# EasyEDA Pro project ProPrj_省赛排插板.epro

# Schematic Schematic1
Board Name: Board1; Create Date: 2025-03-26; Page Name: P1; Project Name: 省赛1; Schematic Name: Schematic1; Update Date: 2025-04-08; Company: 嘉立创EDA; Page Size: A4; Version: V1.0
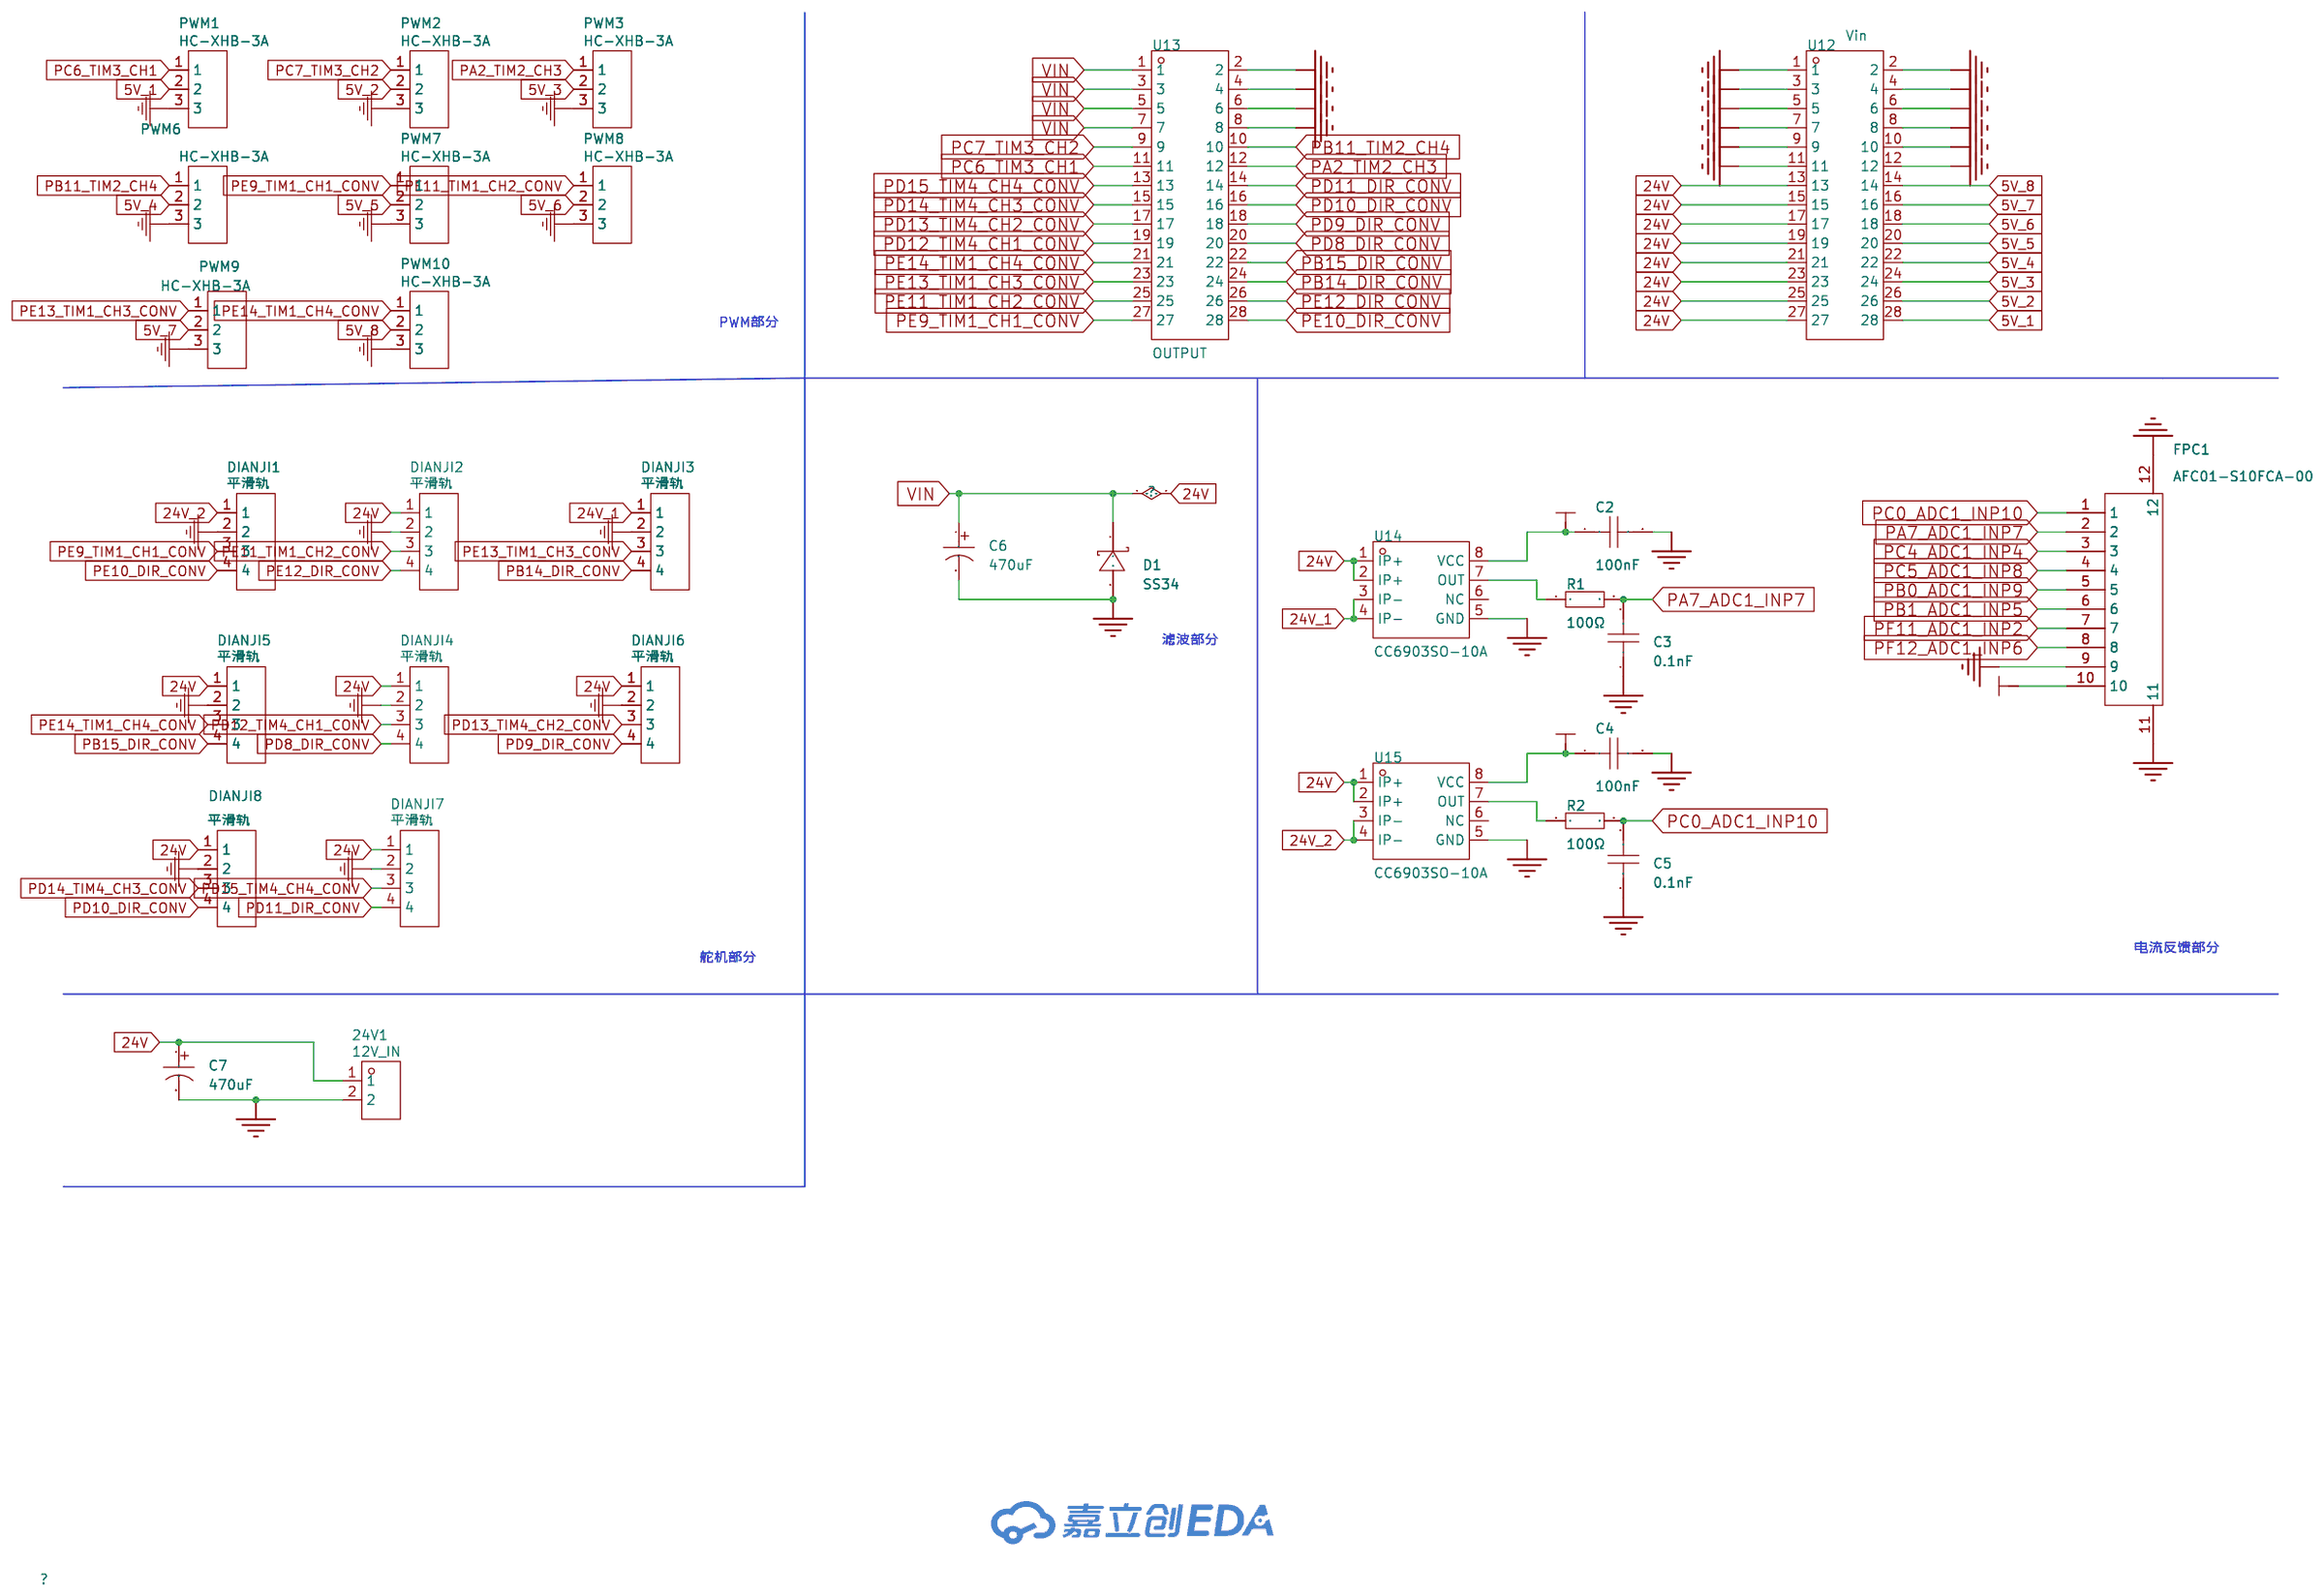
[diagram p0: schematic sheet]

## Parts
24V1  12V_IN  [CONN-TH_XY2500V-A-5.00-2P]
C2  100nF  [C0603]
C3  0.1nF  [C0603]
C4  100nF  [C0603]
C5  0.1nF  [C0603]
C6  470uF  [CAP-TH_BD10.0-P5.00-D1.0-FD]
C7  470uF  [CAP-TH_BD10.0-P5.00-D1.0-FD]
D1  SS34  [SMA_L4.3-W2.6-LS5.2-RD]
DIANJI1  平滑轨  [CONN-TH_XY2500V-A-5.00-4P]
DIANJI2  平滑轨  [CONN-TH_XY2500V-A-5.00-4P]
DIANJI3  平滑轨  [CONN-TH_XY2500V-A-5.00-4P]
DIANJI4  平滑轨  [CONN-TH_XY2500V-A-5.00-4P]
DIANJI5  平滑轨  [CONN-TH_XY2500V-A-5.00-4P]
DIANJI6  平滑轨  [CONN-TH_XY2500V-A-5.00-4P]
DIANJI7  平滑轨  [CONN-TH_XY2500V-A-5.00-4P]
DIANJI8  平滑轨  [CONN-TH_XY2500V-A-5.00-4P]
FPC1  AFC01-S10FCA-00  [FPC-SMD_P0.5-10P_FGS-XJ-H2.0]
PWM1  HC-XHB-3A  [CONN-TH_3P-P2.50_HC-XHB-3A]
PWM2  HC-XHB-3A  [CONN-TH_3P-P2.50_HC-XHB-3A]
PWM3  HC-XHB-3A  [CONN-TH_3P-P2.50_HC-XHB-3A]
PWM6  HC-XHB-3A  [CONN-TH_3P-P2.50_HC-XHB-3A]
PWM7  HC-XHB-3A  [CONN-TH_3P-P2.50_HC-XHB-3A]
PWM8  HC-XHB-3A  [CONN-TH_3P-P2.50_HC-XHB-3A]
PWM9  HC-XHB-3A  [CONN-TH_3P-P2.50_HC-XHB-3A]
PWM10  HC-XHB-3A  [CONN-TH_3P-P2.50_HC-XHB-3A]
R1  100Ω  [Res_1/8W]
R2  100Ω  [Res_1/8W]
U12  Vin  [HDR-TH_28P-P2.54-H-F-R2-C14-W8.5]
U13  OUTPUT  [HDR-TH_28P-P2.54-H-F-R2-C14-W8.5]
U14  CC6903SO-10A  [SOP-8_L4.9-W3.9-P1.27-LS6.0-BL]
U15  CC6903SO-10A  [SOP-8_L4.9-W3.9-P1.27-LS6.0-BL]

## Library data of the parts
24V1 = 12V_IN: Supplier: LCSC; Supplier Part: C505761; Manufacturer: XINLAIYA(新莱亚); Manufacturer Part: XY2500V-A-5.00-2P; JLCPCB Part Class: Extended Part
C2-C5 = CGA0603X7R104K500JT: 容值:100nF;精度:±10%;额定电压:50V;温度系数:X7R;; LCSC Part Name: 100nF ±10% 50V; Supplier Part: C6119867; Manufacturer: HRE(芯声); Supplier Footprint: 0603; JLCPCB Part Class: 扩展库; Datasheet: https://atta.szlcsc.com/upload/public/pdf/source/20250103/C44077DA9E7B3EFAE02F22B6D3D1CBC9.pdf; Supplier: LCSC; Tolerance: ±10%; Voltage Rating: 50V; Temperature Coefficient: X7R
C6 C7 = ERS1HM471G20OT: 容值:470uF;精度:±20%;额定电压:50V;; LCSC Part Name: 470uF ±20% 50V; Supplier Part: C106666; Manufacturer: AISHI(艾华集团); Supplier Footprint: 插件,D10xL20mm; JLCPCB Part Class: 扩展库; Datasheet: https://atta.szlcsc.com/upload/public/pdf/source/20191015/C438940_4B8E60A742BB0AE40DDEF87A5C89089D.pdf; Supplier: LCSC; Tolerance: ±20%; Rated Voltage: 50V; Lead Spacing: 5mm; φD: 10mm; L: 20mm; Lifetime @ Temp: 7000hrs@105℃
D1 = SS34_C8678: 二极管配置:独立式;正向压降(Vf):550mV@3A;直流反向耐压(Vr):40V;整流电流:3A;; LCSC Part Name: 电压:40V 电流:3A; Supplier Part: C8678; Manufacturer: MDD(辰达半导体); Supplier Footprint: SMA(DO-214AC); JLCPCB Part Class: 基础库; Datasheet: https://atta.szlcsc.com/upload/public/pdf/source/20240710/2118BB86FDDB2E0B294389AC1F3F65C8.pdf; Supplier: LCSC; Diode Configuration: 独立式; Forward Voltage (Vf@If): 550mV@3A; Reverse Voltage (Vr): 40V; Rectified Current: 3A; Reverse Leakage Current (Ir): 500uA@40V
DIANJI1-DIANJI8 = 平滑轨: Supplier: LCSC; Supplier Part: C505763; Manufacturer: XINLAIYA(新莱亚); Manufacturer Part: XY2500V-A-5.00-4P; JLCPCB Part Class: Extended Part
FPC1 = AFC01-S10FCA-00: 锁定特性:翻盖式;触点类型:下接;触点数量:10P;间距:0.5mm;安装类型:卧贴;; LCSC Part Name: 间距:0.5mm P数:10P 翻盖式 下接; Supplier Part: C262659; Manufacturer: JS(钜硕电子); Supplier Footprint: SMD,P=0.5mm,卧贴; JLCPCB Part Class: 扩展库; Datasheet: https://atta.szlcsc.com/upload/public/pdf/source/20190816/C413942_2A72D1AC756EAE17EEDF756A339D4500.pdf; Supplier: LCSC; Locking Feature: 翻盖式; Contact Type: 下接; Number of Contacts: 10P; Pitch: 0.5mm; Mounting Type: 卧贴; FFC, FCB Thickness: 0.3mm; Height Above Board: 2mm
PWM1-PWM3 PWM6-PWM10 = HC-XHB-3A: Supplier: LCSC; Supplier Part: C2845491; Manufacturer: HCTL(华灿天禄); JLCPCB Part Class: Extended Part
R1 R2 = Res_AXIAL-1/8W: Supplier Footprint: 轴向引线
U12 U13 = PM254-2-14-W-8.5: 插孔结构:2x14P;间距:2.54mm;行距:2.54mm;圆孔/方孔:方孔;安装类型:弯插;排数:双排;总孔位数:28P;额定电流:3A;额定电压:-;插孔方向:侧面;塑高:8.5mm;触头材质:铜合金;工作温度范围:-40℃~+105℃;焊接温度(最大值):260℃@5S;; LCSC Part Name: 2x14P 间距:2.54mm 弯插; Supplier Part: C2897434; Manufacturer: HCTL(华灿天禄); Supplier Footprint: 弯插,P=2.54mm; JLCPCB Part Class: 扩展库; Datasheet: https://atta.szlcsc.com/upload/public/pdf/source/20230609/283C0D22EF4E6FFE03D5A855876981ED.pdf; Supplier: LCSC; Holes Structure: 2x14P; Pitch: 2.54mm; Row Spacing: 2.54mm; Circular Hole / Square Hole: 方孔; Mounting Type: 弯插; Number of Rows: 双排; Number of Holes: 28P; Current Rating (Max): 3A; Holes Direction: 侧面; Insulation Height: 8.5mm; Contact Material: 铜合金; Operating Temperature Range: -40℃~+105℃; Soldering Temperature(Max): 260℃@5S
U14 U15 = CC6903SO-10A: 电流测量范围:-10A~10A;隔离耐压:100Vrms;灵敏度:132mV/A;; Supplier Part: C469386; Manufacturer: CrossChip(成都芯进); Supplier Footprint: SOP-8; JLCPCB Part Class: 扩展库; Datasheet: https://atta.szlcsc.com/upload/public/pdf/source/20210401/C469386_736CACCB33E89B0F82D9E8414A64AB06.pdf; Supplier: LCSC; Current Range: -10A~10A; Supply Voltage: 3.3V; Isolated Voltage Withstand: 100Vrms; Sensitivity: 132mV/A; Standby Current: 5mA; Operating Temperature: -40℃~+125℃

## Nets
3V32: C2.1 C4.1 FPC1.10 U14.8(VCC) U15.8(VCC)
5V_1: PWM1.2 U12.28
5V_2: PWM2.2 U12.26
5V_3: PWM3.2 U12.24
5V_4: PWM6.2 U12.22
5V_5: PWM7.2 U12.20
5V_6: PWM8.2 U12.18
5V_7: PWM9.2 U12.16
5V_8: PWM10.2 U12.14
24V: 24V1.1 C6.1 C7.1 D1.1(K) DIANJI2.1 DIANJI4.1 DIANJI5.1 DIANJI6.1 DIANJI7.1 DIANJI8.1 U12.13 U12.15 U12.17 U12.19 U12.21 U12.23 U12.25 U12.27 U13.1 U13.3 U13.5 U13.7 U14.1(IP+) U14.2(IP+) U15.1(IP+) U15.2(IP+)
24V_1: DIANJI3.1 U14.3(IP-) U14.4(IP-)
24V_2: DIANJI1.1 U15.3(IP-) U15.4(IP-)
GND: 24V1.2 C2.2 C3.1 C4.2 C5.1 C6.2 C7.2 D1.2(A) DIANJI1.2 DIANJI2.2 DIANJI3.2 DIANJI4.2 DIANJI5.2 DIANJI6.2 DIANJI7.2 DIANJI8.2 FPC1.9 FPC1.11 FPC1.12 PWM1.3 PWM2.3 PWM3.3 PWM6.3 PWM7.3 PWM8.3 PWM9.3 PWM10.3 U12.1 U12.2 U12.3 U12.4 U12.5 U12.6 U12.7 U12.8 U12.9 U12.10 U12.11 U12.12 U13.2 U13.4 U13.6 U13.8 U14.5(GND) U15.5(GND)
PA2_TIM2_CH3: PWM3.1 U13.12
PA7_ADC1_INP7: C3.2 FPC1.2 R1.2
PB0_ADC1_INP9: FPC1.5
PB1_ADC1_INP5: FPC1.6
PB11_TIM2_CH4: PWM6.1 U13.10
PB14_DIR_CONV: DIANJI3.4 U13.24
PB15_DIR_CONV: DIANJI5.4 U13.22
PC0_ADC1_INP10: C5.2 FPC1.1 R2.2
PC4_ADC1_INP4: FPC1.3
PC5_ADC1_INP8: FPC1.4
PC6_TIM3_CH1: PWM1.1 U13.11
PC7_TIM3_CH2: PWM2.1 U13.9
PD8_DIR_CONV: DIANJI4.4 U13.20
PD9_DIR_CONV: DIANJI6.4 U13.18
PD10_DIR_CONV: DIANJI8.4 U13.16
PD11_DIR_CONV: DIANJI7.4 U13.14
PD12_TIM4_CH1_CONV: DIANJI4.3 U13.19
PD13_TIM4_CH2_CONV: DIANJI6.3 U13.17
PD14_TIM4_CH3_CONV: DIANJI8.3 U13.15
PD15_TIM4_CH4_CONV: DIANJI7.3 U13.13
PE9_TIM1_CH1_CONV: DIANJI1.3 PWM7.1 U13.27
PE10_DIR_CONV: DIANJI1.4 U13.28
PE11_TIM1_CH2_CONV: DIANJI2.3 PWM8.1 U13.25
PE12_DIR_CONV: DIANJI2.4 U13.26
PE13_TIM1_CH3_CONV: DIANJI3.3 PWM9.1 U13.23
PE14_TIM1_CH4_CONV: DIANJI5.3 PWM10.1 U13.21
PF11_ADC1_INP2: FPC1.7
PF12_ADC1_INP6: FPC1.8
$1N7510: R1.1 U14.7(OUT)
$1N7913: R2.1 U15.7(OUT)

Not connected (* = marked no-connect by the designer): U14 6(NC); U15 6(NC)

## Notes on the sheet
- PWM部分
- 滤波部分
- 电流反馈部分
- 舵机部分

# Board PCB1
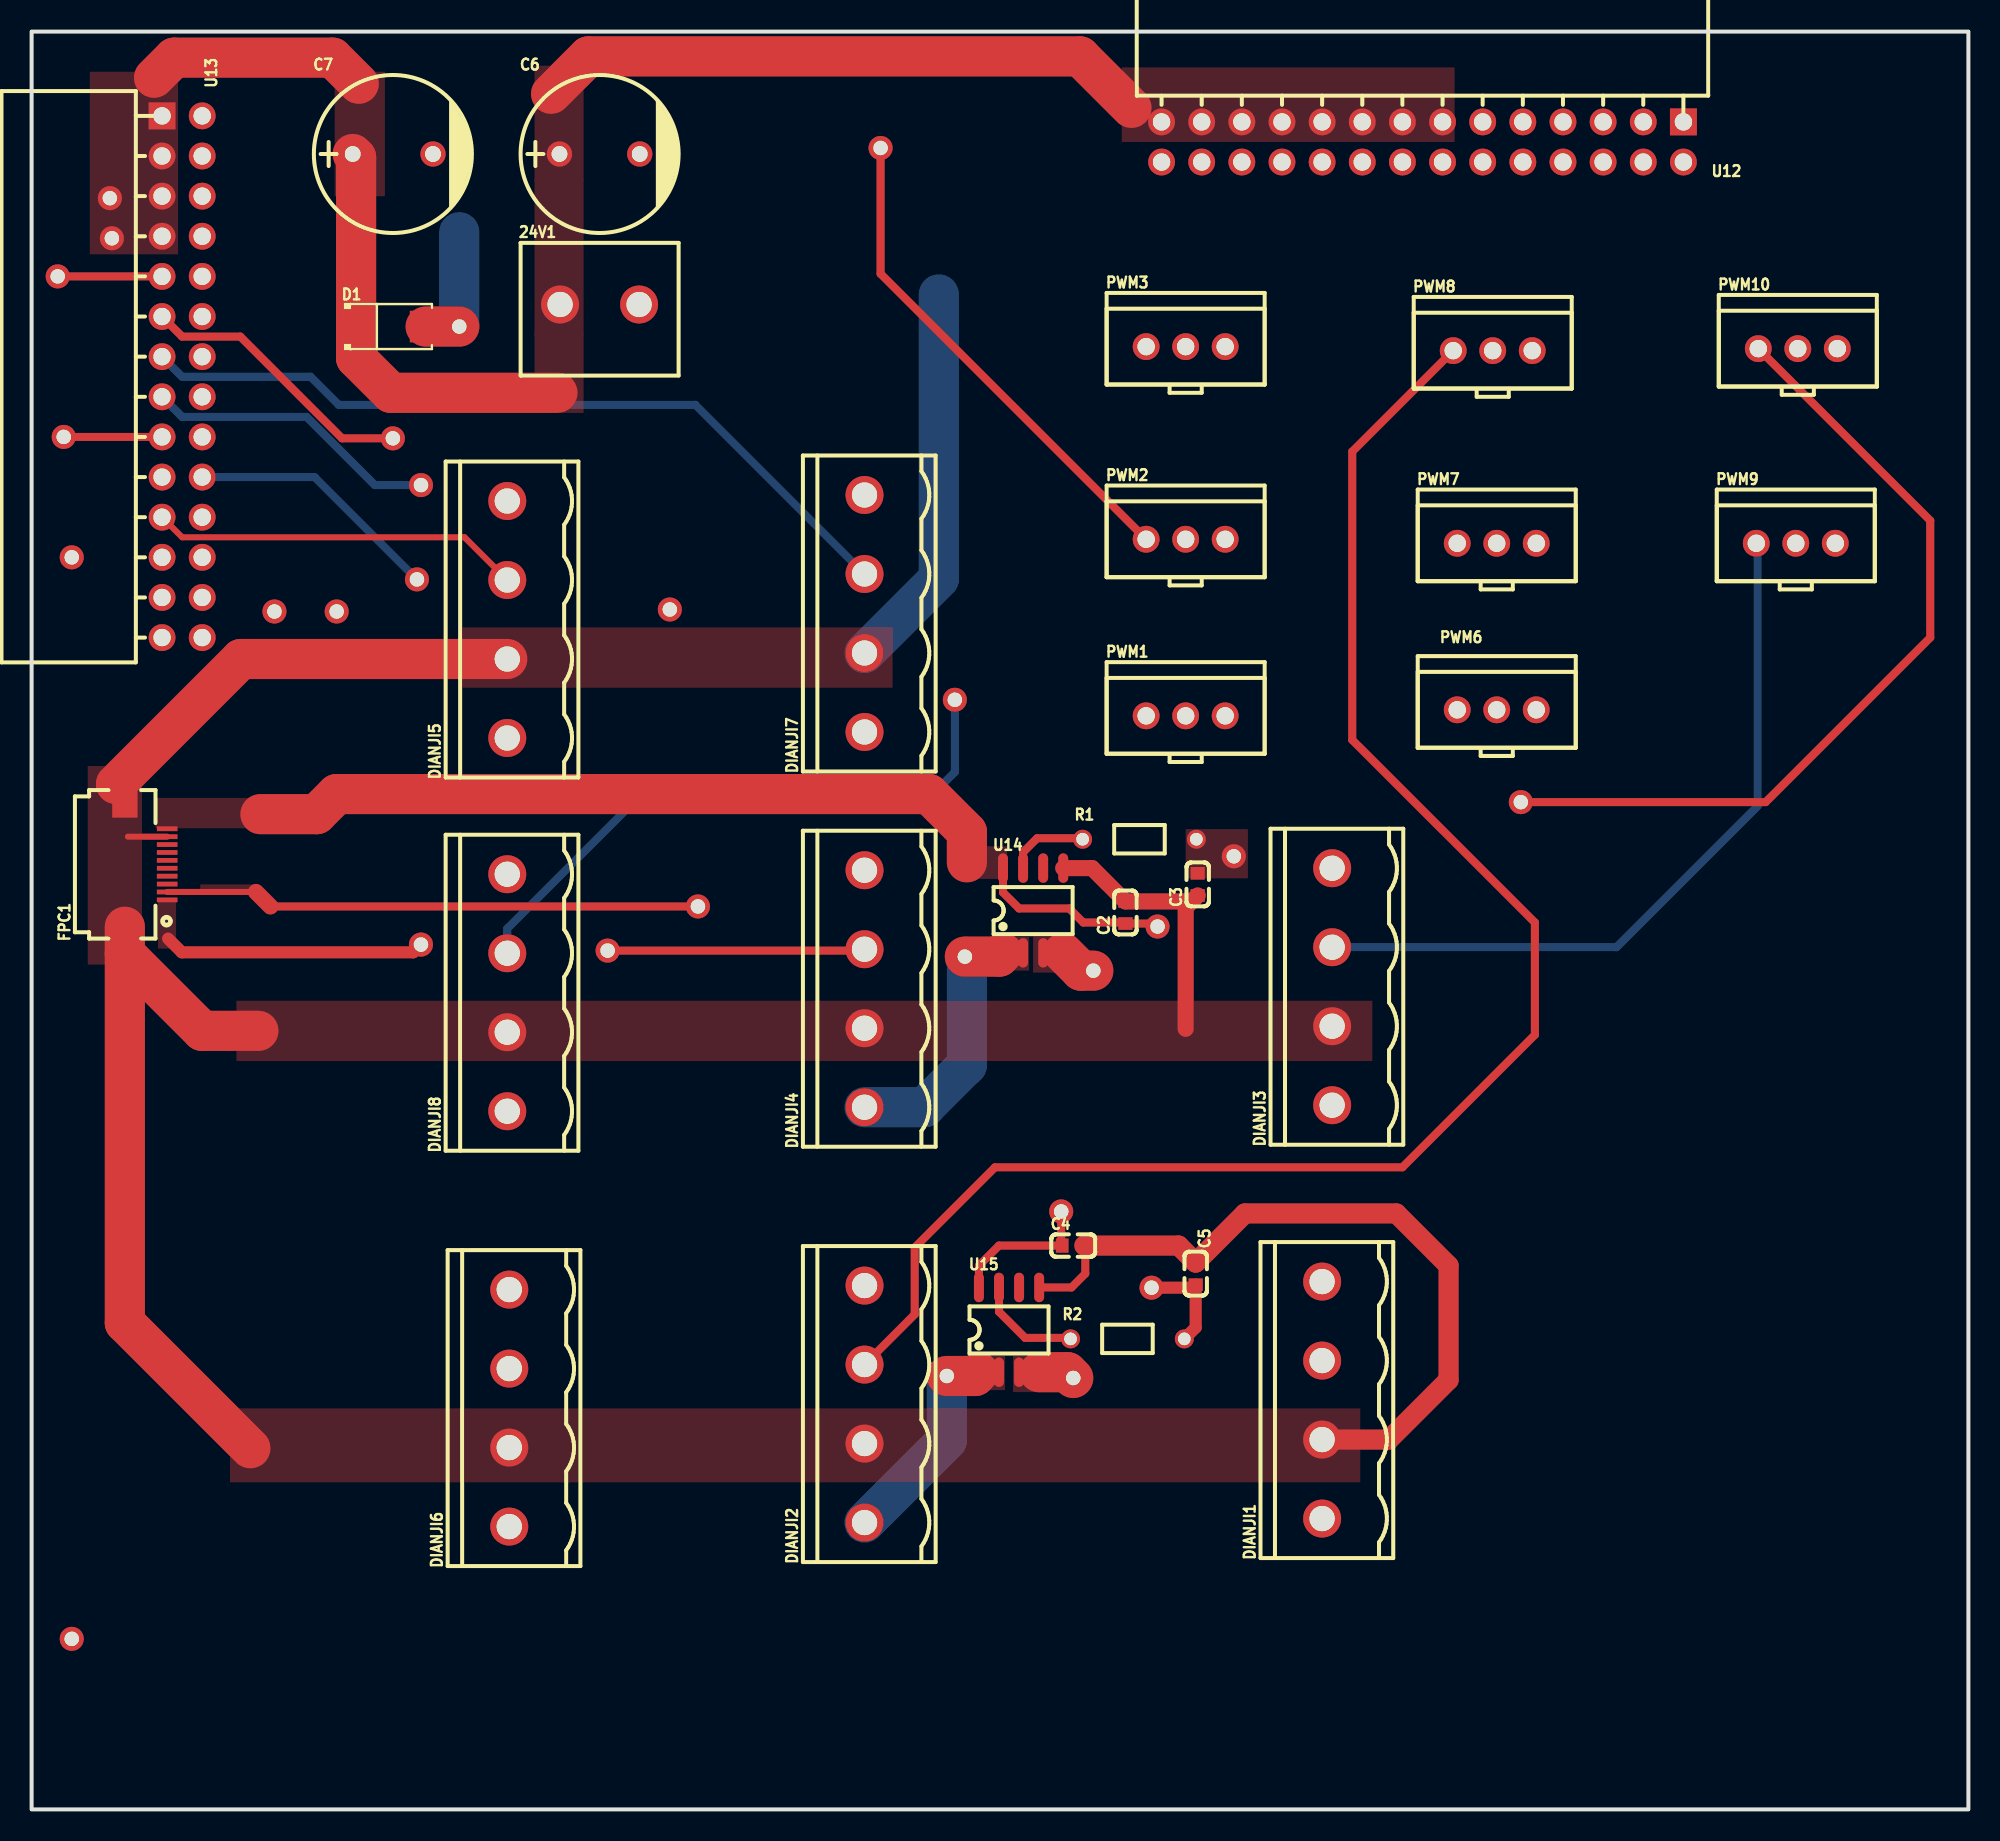
[diagram p1: board, top side]
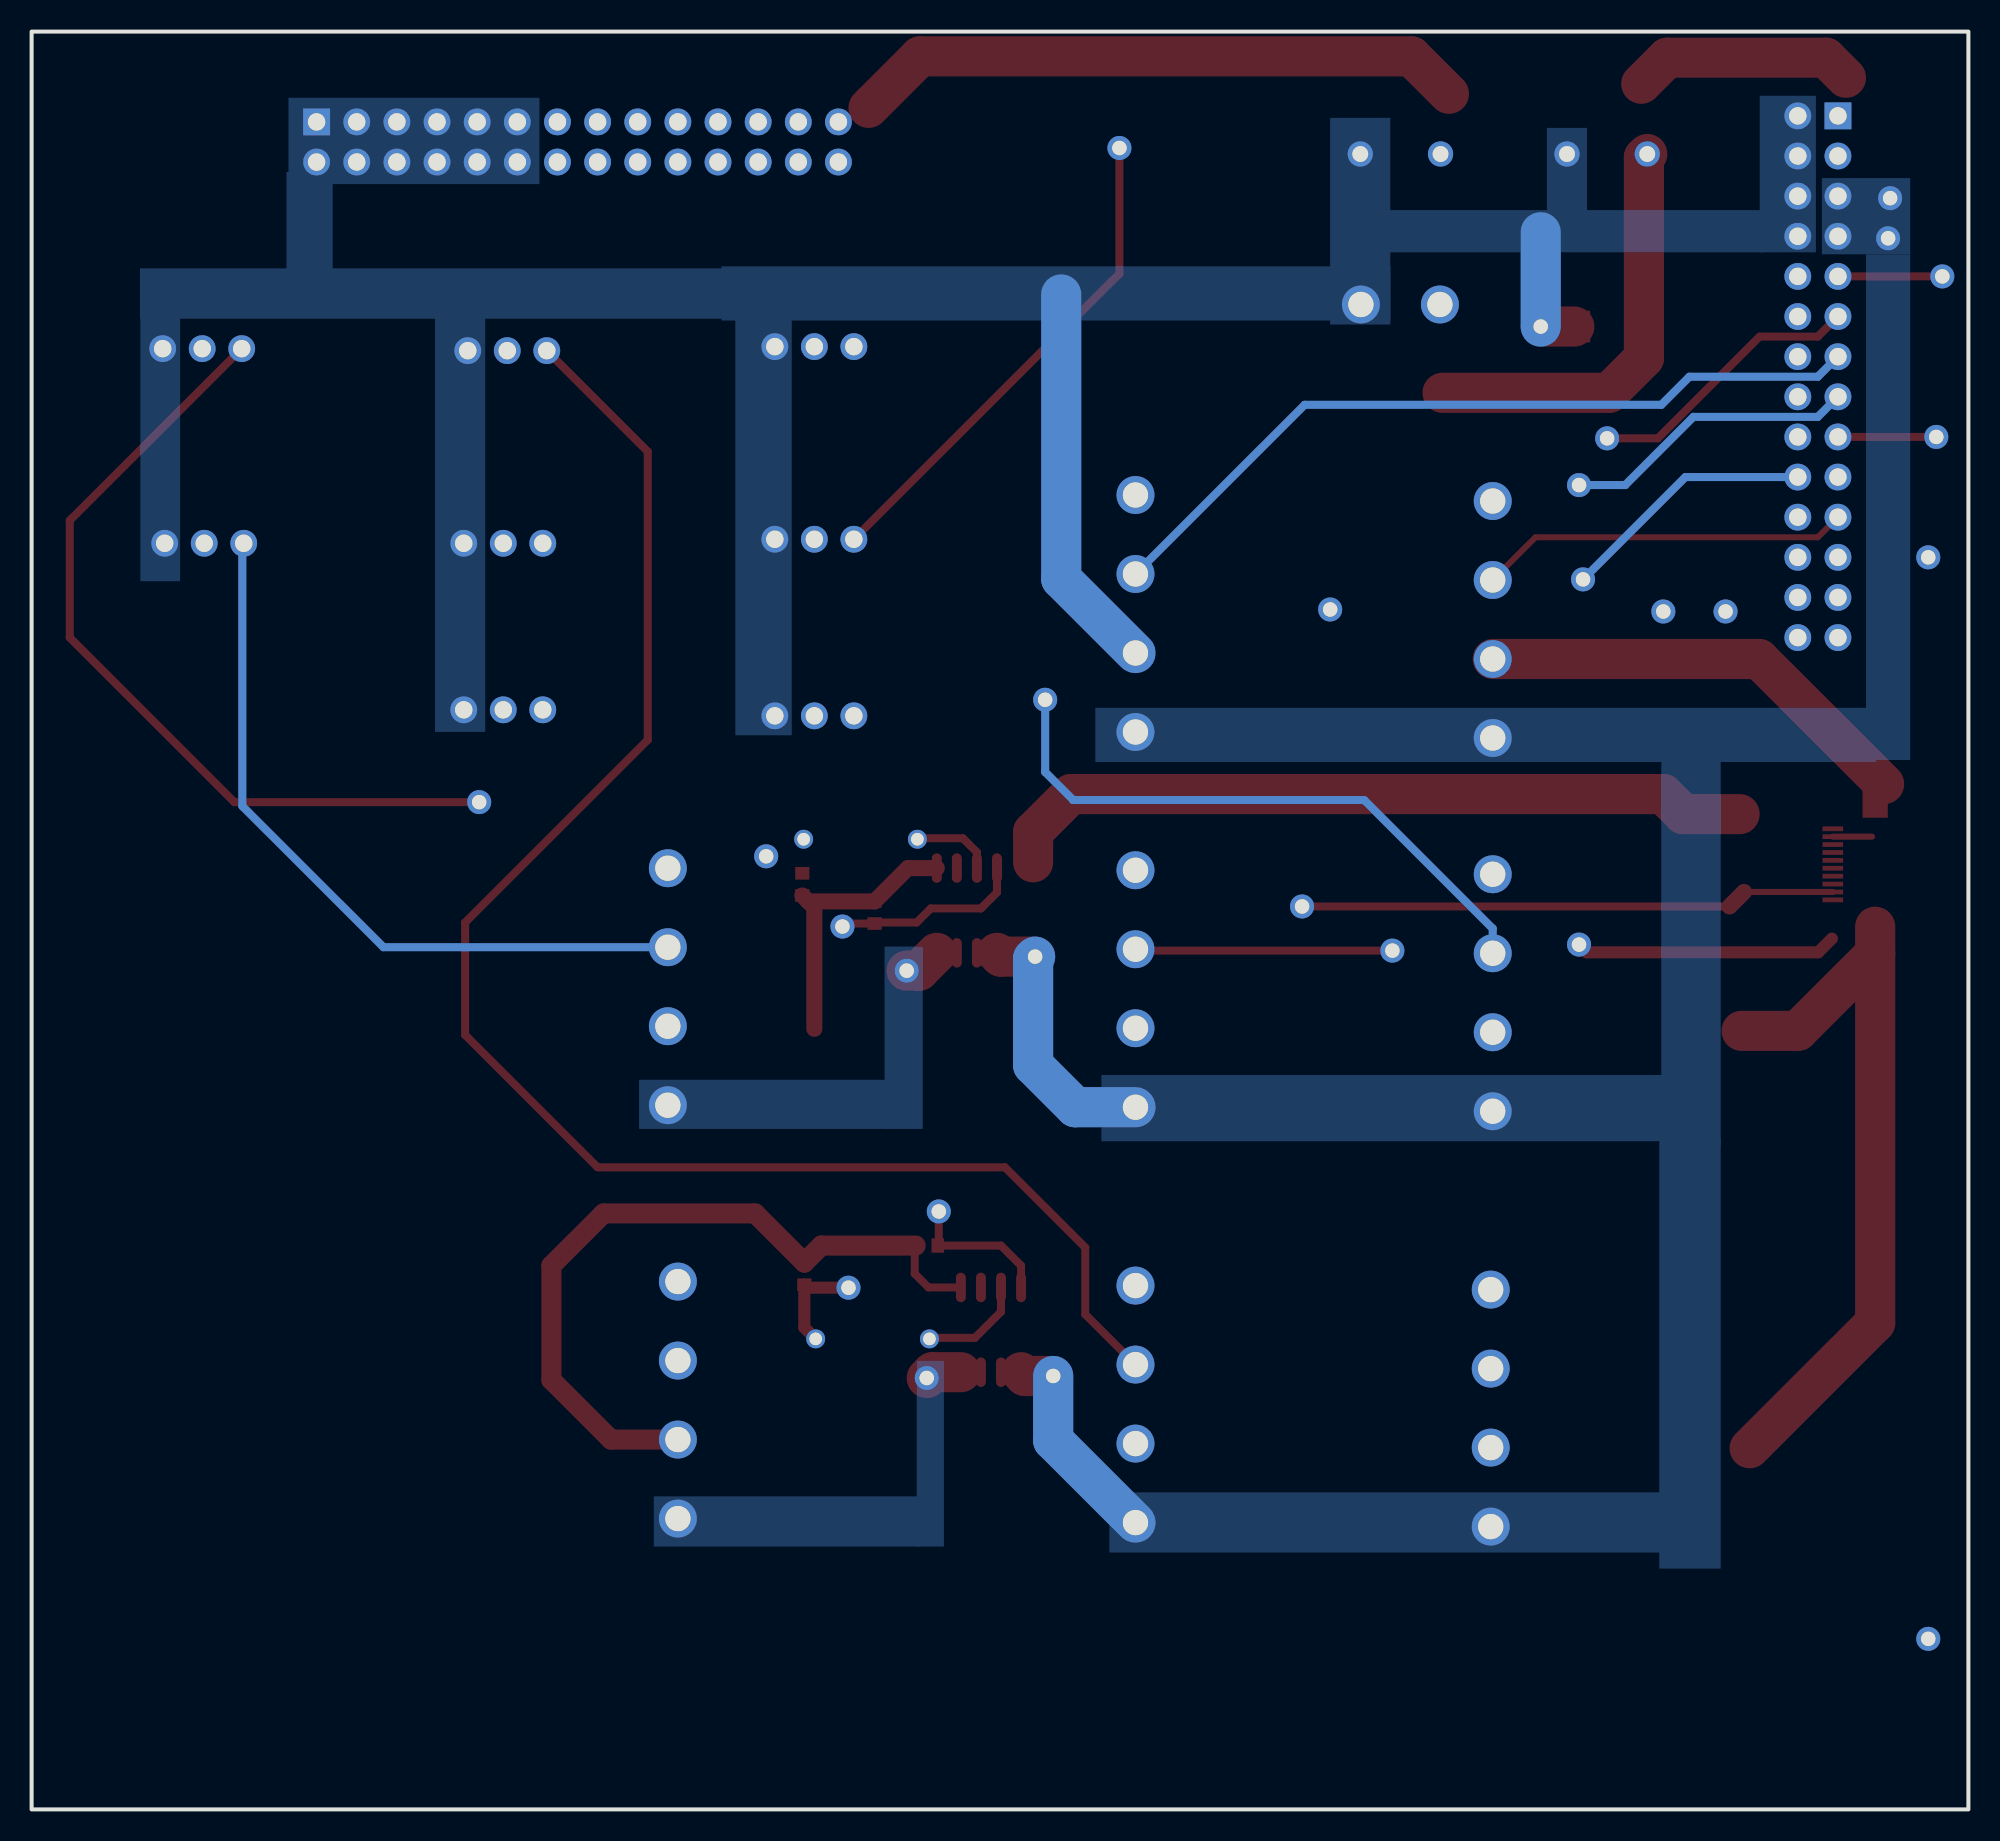
[diagram p2: board, bottom side, seen from below]

Outline 122.56 x 112.52 mm; copper layers: Top Layer, Inner1, Inner2, Bottom Layer. Coordinates in mm from the lower left corner of the outline.
Outline path: rectangle 0,112.52 122.56,0
Stack: Top Layer 0.035mm 外层铜厚1oz / Dielectric1 0.2104mm 7628 RC49% 8.6mil / Inner1 0.0152mm 内层铜厚 / Dielectric2 1.065mm 1.1mm H/HOZ Copper / Inner2 0.0152mm 内层铜厚 / Dielectric3 0.2104mm 7628 RC49% 8.6mil / Bottom Layer 0.035mm 外层铜厚1oz

## Design rules (mm)
template: JLCPCB Capability(Two Layers Board)
spacing copperThickness1oz (default): track to track 0.102, other pairs 0.152 to 0.3
spacing copperThickness2oz: track to track 0.203, other pairs 0.152 to 0.3
track width copperThickness1oz (default): min 0.127, default 0.254, max 2.54
track width copperThickness2oz: min 0.203, default 0.254, max 2.54
differential pair differentialPair (default): width min 0.127, default 0.254, max 2.54; gap min 0.152, default 0.152
via viaSize (default): diameter min 0.5, default 0.61, max 10; hole min 0.3, default 0.305, max 6.3
net GND uses copperThickness2oz
net 24V_1 uses copperThickness2oz
net 24V uses copperThickness2oz
net 24V_2 uses copperThickness2oz
net 3V32 uses copperThickness2oz
net 5V_1 uses copperThickness2oz
net 5V_2 uses copperThickness2oz
net 5V_3 uses copperThickness2oz
net 5V_4 uses copperThickness2oz
net 5V_5 uses copperThickness2oz
net 5V_6 uses copperThickness2oz
net 5V_7 uses copperThickness2oz
net 5V_8 uses copperThickness2oz
net $1N7510 uses copperThickness2oz
net $1N7913 uses copperThickness2oz

## Placement (name value [footprint] x y rotation side)
24V1  12V_IN  [CONN-TH_XY2500V-A-5.00-2P]  35.94 95.25 0 top
C2  100nF  [C0603]  69.22 56.77 90 top
C3  0.1nF  [C0603]  73.79 58.55 90 top
C4  100nF  [C0603]  65.91 35.69 0 top
C5  0.1nF  [C0603]  73.66 33.91 270 top
C6  470uF  [CAP-TH_BD10.0-P5.00-D1.0-FD]  35.94 104.78 0 top
C7  470uF  [CAP-TH_BD10.0-P5.00-D1.0-FD]  22.86 104.78 0 top
D1  SS34  [SMA_L4.3-W2.6-LS5.2-RD]  22.73 93.85 0 top
DIANJI1  平滑轨  [CONN-TH_XY2500V-A-5.00-4P]  81.66 25.91 90 top
DIANJI2  平滑轨  [CONN-TH_XY2500V-A-5.00-4P]  52.7 25.65 90 top
DIANJI3  平滑轨  [CONN-TH_XY2500V-A-5.00-4P]  82.3 52.07 90 top
DIANJI4  平滑轨  [CONN-TH_XY2500V-A-5.00-4P]  52.7 51.94 90 top
DIANJI5  平滑轨  [CONN-TH_XY2500V-A-5.00-4P]  30.1 75.31 90 top
DIANJI6  平滑轨  [CONN-TH_XY2500V-A-5.00-4P]  30.23 25.4 90 top
DIANJI7  平滑轨  [CONN-TH_XY2500V-A-5.00-4P]  52.7 75.69 90 top
DIANJI8  平滑轨  [CONN-TH_XY2500V-A-5.00-4P]  30.1 51.69 90 top
FPC1  AFC01-S10FCA-00  [FPC-SMD_P0.5-10P_FGS-XJ-H2.0]  7.24 59.82 90 top
NOREF  -  [Pad_e557]  53.72 105.16 0 top
NOREF#2  -  [Pad_e539]  2.54 79.25 0 top
NOREF#3  -  [Pad_e108]  27.06 93.85 0 top
NOREF#4  -  [Pad_e78]  4.95 101.98 0 top
NOREF#5  -  [Pad_e379]  24.64 54.74 0 top
NOREF#6  -  [Pad_e474]  2.03 86.87 0 top
NOREF#7  -  [Pad_e721]  58.42 70.23 0 top
NOREF#8  -  [Pad_e288]  57.91 27.43 0 top
NOREF#9  -  [Pad_e614]  24.38 77.85 0 top
NOREF#10  -  [Pad_e289]  65.91 27.31 0 top
NOREF#11  -  [Pad_e547]  2.54 10.8 0 top
NOREF#12  -  [Pad_e554]  1.65 97.03 0 top
NOREF#13  -  [Pad_e383]  70.87 33.02 0 top
NOREF#14  -  [Pad_e441]  76.07 60.33 0 top
NOREF#15  -  [Pad_e720]  40.39 75.95 0 top
NOREF#16  -  [Pad_e465]  71.25 55.88 0 top
NOREF#17  -  [Pad_e280]  67.18 53.09 0 top
NOREF#18  -  [Pad_e661]  36.45 54.36 0 top
NOREF#19  -  [Pad_e272]  59.06 53.98 0 top
NOREF#20  -  [Pad_e79]  5.08 99.44 0 top
NOREF#21  -  [Pad_e599]  94.23 63.75 0 top
NOREF#22  -  [Pad_e710]  24.64 83.82 0 top
NOREF#23  -  [Pad_e463]  65.15 37.85 0 top
NOREF#24  -  [Pad_e696]  15.37 75.82 0 top
NOREF#25  -  [Pad_e646]  22.86 86.78 0 top
NOREF#26  -  [Pad_e439]  42.16 57.15 0 top
NOREF#27  -  [Pad_e698]  19.3 75.82 0 top
PWM1  HC-XHB-3A  [CONN-TH_3P-P2.50_HC-XHB-3A]  73.03 69.22 0 top
PWM2  HC-XHB-3A  [CONN-TH_3P-P2.50_HC-XHB-3A]  73.03 80.39 0 top
PWM3  HC-XHB-3A  [CONN-TH_3P-P2.50_HC-XHB-3A]  73.03 92.58 0 top
PWM6  HC-XHB-3A  [CONN-TH_3P-P2.50_HC-XHB-3A]  92.71 69.6 0 top
PWM7  HC-XHB-3A  [CONN-TH_3P-P2.50_HC-XHB-3A]  92.71 80.14 0 top
PWM8  HC-XHB-3A  [CONN-TH_3P-P2.50_HC-XHB-3A]  92.46 92.33 0 top
PWM9  HC-XHB-3A  [CONN-TH_3P-P2.50_HC-XHB-3A]  111.63 80.14 0 top
PWM10  HC-XHB-3A  [CONN-TH_3P-P2.50_HC-XHB-3A]  111.76 92.46 0 top
R1  100Ω  [Res_1/8W]  70.1 61.34 0 top
R2  100Ω  [Res_1/8W]  69.34 29.72 0 top
U12  Vin  [HDR-TH_28P-P2.54-H-F-R2-C14-W8.5]  88.01 105.54 180 top
U13  OUTPUT  [HDR-TH_28P-P2.54-H-F-R2-C14-W8.5]  9.52 90.68 270 top
U14  CC6903SO-10A  [SOP-8_L4.9-W3.9-P1.27-LS6.0-BL]  63.37 56.9 0 top
U15  CC6903SO-10A  [SOP-8_L4.9-W3.9-P1.27-LS6.0-BL]  61.85 30.35 0 top

## Footprints (pads in the part's own frame, mm; a bottom-side part is the same pattern mirrored in y, then rotated)
C0603
  rect 0.8x0.9 smd: 1(-0.7,0) 2(0.7,0)
CAP-TH_BD10.0-P5.00-D1.0-FD
  round 1.6 hole 1: 1(-2.54,0) 2(2.54,0)
CONN-TH_3P-P2.50_HC-XHB-3A
  round 1.7 hole 1.1: 1(-2.5,0) 2(0,0) 3(2.5,0)
CONN-TH_XY2500V-A-5.00-2P
  round 2.4 hole 1.6: 1(-2.5,0) 2(2.5,0)
CONN-TH_XY2500V-A-5.00-4P
  round 2.4 hole 1.6: 1(-7.5,0) 2(-2.5,0) 3(2.5,0) 4(7.5,0)
FPC-SMD_P0.5-10P_FGS-XJ-H2.0
  rect 0.3x1.3 smd: 1(-2.25,-1.339) 2(-1.75,-1.339) 3(-1.25,-1.34) 4(-0.75,-1.339) 5(-0.25,-1.34) 6(0.25,-1.339) 7(0.75,-1.339) 8(1.25,-1.339) 9(1.75,-1.339) 10(2.25,-1.34)
  rect 2x1.6 smd: 11(3.95,1.34) 12(-3.95,1.34)
HDR-TH_28P-P2.54-H-F-R2-C14-W8.5
  rect 1.7x1.7 hole 1.1: 1(-16.51,-1.27)
  round 1.7 hole 1.1: 2(-16.51,1.27) 3(-13.97,-1.27) 4(-13.97,1.27) 5(-11.43,-1.27) 6(-11.43,1.27) 7(-8.89,-1.27) 8(-8.89,1.27) 9(-6.35,-1.27) 10(-6.35,1.27) 11(-3.81,-1.27) 12(-3.81,1.27) 13(-1.27,-1.27) 14(-1.27,1.27) 15(1.27,-1.27) 16(1.27,1.27) 17(3.81,-1.27) 18(3.81,1.27) 19(6.35,-1.27) 20(6.35,1.27) 21(8.89,-1.27) 22(8.89,1.27) 23(11.43,-1.27) 24(11.43,1.27) 25(13.97,-1.27) 26(13.97,1.27) 27(16.51,-1.27) 28(16.51,1.27)
Pad_e78
  round 1.524 hole 0.914: 1(0,0)
Pad_e79
  round 1.524 hole 0.914: 2(0,0)
Pad_e108
  round 1.524 hole 0.914: 1(0,0)
Pad_e272
  round 1.524 hole 0.914: 1(0,0)
Pad_e280
  round 1.524 hole 0.914: 1(0,0)
Pad_e288
  round 1.524 hole 0.914: 1(0,0)
Pad_e289
  round 1.524 hole 0.914: 2(0,0)
Pad_e379
  round 1.524 hole 0.914: 1(0,0)
Pad_e383
  round 1.524 hole 0.914: 1(0,0)
Pad_e439
  round 1.524 hole 0.914: 1(0,0)
Pad_e441
  round 1.524 hole 0.914: 1(0,0)
Pad_e463
  round 1.524 hole 0.914: 1(0,0)
Pad_e465
  round 1.524 hole 0.914: 1(0,0)
Pad_e474
  round 1.524 hole 0.914: 1(0,0)
Pad_e539
  round 1.524 hole 0.914: 1(0,0)
Pad_e547
  round 1.524 hole 0.914: 1(0,0)
Pad_e554
  round 1.524 hole 0.914: 1(0,0)
Pad_e557
  round 1.524 hole 0.914: 1(0,0)
Pad_e599
  round 1.524 hole 0.914: 1(0,0)
Pad_e614
  round 1.524 hole 0.914: 1(0,0)
Pad_e646
  round 1.524 hole 0.914: 1(0,0)
Pad_e661
  round 1.524 hole 0.914: 1(0,0)
Pad_e696
  round 1.524 hole 0.914: 1(0,0)
Pad_e698
  round 1.524 hole 0.914: 1(0,0)
Pad_e710
  round 1.524 hole 0.914: 1(0,0)
Pad_e720
  round 1.524 hole 0.914: 1(0,0)
Pad_e721
  round 1.524 hole 0.914: 2(0,0)
Res_1/8W
  round 1.199 hole 0.8: 1(-3.599,0.063) 2(3.599,0.063)
SMA_L4.3-W2.6-LS5.2-RD
  rect 2x2 smd: 1(-2.2,0) 2(2.2,0)
SOP-8_L4.9-W3.9-P1.27-LS6.0-BL
  oval 0.63x1.865 smd: 1(-1.905,-2.683) 2(-0.635,-2.683) 3(0.635,-2.683) 4(1.905,-2.683) 5(1.905,2.683) 6(0.635,2.683) 7(-0.635,2.683) 8(-1.905,2.683)

## Nets
3V32: C2.1 C4.1 FPC1.10 NOREF#16.1 NOREF#23.1 U14.8 U15.8
5V_1: PWM1.2 U12.28
5V_2: PWM2.2 U12.26
5V_3: PWM3.2 U12.24
5V_4: PWM6.2 U12.22
5V_5: PWM7.2 U12.20
5V_6: PWM8.2 U12.18
5V_7: PWM9.2 U12.16
5V_8: PWM10.2 U12.14
24V: 24V1.1 C6.1 C7.1 D1.1 DIANJI2.1 DIANJI4.1 DIANJI5.1 DIANJI6.1 DIANJI7.1 DIANJI8.1 NOREF#4.1 NOREF#8.1 NOREF#19.1 NOREF#20.2 U12.13 U12.15 U12.17 U12.19 U12.21 U12.23 U12.25 U12.27 U13.1 U13.3 U13.5 U13.7 U14.1 U14.2 U15.1 U15.2
24V_1: DIANJI3.1 NOREF#17.1 U14.3 U14.4
24V_2: DIANJI1.1 NOREF#10.2 U15.3 U15.4
GND: 24V1.2 C2.2 C3.1 C4.2 C5.1 C6.2 C7.2 D1.2 DIANJI1.2 DIANJI2.2 DIANJI3.2 DIANJI4.2 DIANJI5.2 DIANJI6.2 DIANJI7.2 DIANJI8.2 FPC1.9 FPC1.11 FPC1.12 NOREF#3.1 PWM1.3 PWM2.3 PWM3.3 PWM6.3 PWM7.3 PWM8.3 PWM9.3 PWM10.3 U12.1 U12.2 U12.3 U12.4 U12.5 U12.6 U12.7 U12.8 U12.9 U12.10 U12.11 U12.12 U13.2 U13.4 U13.6 U13.8 U14.5 U15.5
PA2_TIM2_CH3: PWM3.1 U13.12
PA7_ADC1_INP7: C3.2 FPC1.2 NOREF#14.1 NOREF#26.1 R1.2
PB0_ADC1_INP9: FPC1.5
PB1_ADC1_INP5: FPC1.6
PB11_TIM2_CH4: PWM6.1 U13.10
PB14_DIR_CONV: DIANJI3.4 U13.24
PB15_DIR_CONV: DIANJI5.4 U13.22
PC0_ADC1_INP10: C5.2 FPC1.1 NOREF#5.1 NOREF#13.1 R2.2
PC4_ADC1_INP4: FPC1.3
PC5_ADC1_INP8: FPC1.4
PC6_TIM3_CH1: NOREF#25.1 PWM1.1 U13.11
PC7_TIM3_CH2: NOREF.1 NOREF#12.1 PWM2.1 U13.9
PD8_DIR_CONV: DIANJI4.4 NOREF#9.1 U13.20
PD9_DIR_CONV: DIANJI6.4 U13.18
PD10_DIR_CONV: DIANJI8.4 U13.16
PD11_DIR_CONV: DIANJI7.4 U13.14
PD12_TIM4_CH1_CONV: DIANJI4.3 NOREF#18.1 NOREF#24.1 NOREF#27.1 U13.19
PD13_TIM4_CH2_CONV: DIANJI6.3 NOREF#6.1 U13.17
PD14_TIM4_CH3_CONV: DIANJI8.3 NOREF#7.2 NOREF#15.1 NOREF#22.1 U13.15
PD15_TIM4_CH4_CONV: DIANJI7.3 U13.13
PE9_TIM1_CH1_CONV: DIANJI1.3 PWM7.1 U13.27
PE10_DIR_CONV: DIANJI1.4 U13.28
PE11_TIM1_CH2_CONV: DIANJI2.3 PWM8.1 U13.25
PE12_DIR_CONV: DIANJI2.4 U13.26
PE13_TIM1_CH3_CONV: DIANJI3.3 NOREF#2.1 NOREF#11.1 PWM9.1 U13.23
PE14_TIM1_CH4_CONV: DIANJI5.3 NOREF#21.1 PWM10.1 U13.21
PF11_ADC1_INP2: FPC1.7
PF12_ADC1_INP6: FPC1.8
$1N7510: R1.1 U14.7
$1N7913: R2.1 U15.7

Pads without a net: U14 6; U15 6

## Routing (per net, layer and track width the routed paths; a pad name or vN(x,y) marks a point on that pad's centre or on a via; arc(x,y) is an arc through that point)
3V32: length 90.3
  Top Layer w0.508: U15.8 59.94,34.42 61.21,35.69 C4.1 65.15,35.75 NOREF#23.1 ; U14.8 61.47,58.04 62.48,57.02 65.66,57.02 66.55,56.13 69.15,56.13 C2.1 71.06,56.07 NOREF#16.1
  Top Layer w2.54: 14.48,62.99 18.03,62.99 19.3,64.26 56.78,64.26 59.18,61.86 59.18,59.94
  Inner1 w0.762: NOREF#16.1 71.25,43.94 NOREF#23.1
5V_1: length 51.6
  Inner2 w1.27: U12.28 66.29,104.27 60.32,98.3 60.32,79.88 64.9,75.31 70.99,75.31 73.03,73.28 PWM1.2
5V_2: length 36.8
  Inner2 w1.27: U12.26 74.04,103.63 71.63,101.22 67.69,101.22 62.61,96.14 62.61,90.3 66.93,85.98 69.6,85.98 73.03,82.55 PWM2.2
5V_3: length 13.3
  Inner2 w1.27: PWM3.2 72.9,92.71 72.9,98.43 76.58,102.11 U12.24
5V_4: length 42.2
  Inner2 w1.27: U12.22 79.12,81.79 85.98,74.93 89.28,74.93 92.71,71.5 PWM6.2
5V_5: length 30
  Inner2 w1.27: PWM7.2 92.71,82.68 88.52,86.87 86.36,86.87 81.66,91.57 U12.20
5V_6: length 18.1
  Inner2 w1.27: U12.18 84.2,98.81 86.36,96.65 91.06,96.65 92.33,95.38 92.33,92.46 PWM8.2
5V_7: length 41.1
  Inner2 w1.27: PWM9.2 111.63,82.42 107.31,86.74 102.23,86.74 99.31,89.66 99.31,96.01 96.01,99.31 89.66,99.31 86.74,102.24 U12.16
5V_8: length 31.2
  Inner2 w1.27: PWM10.2 111.76,98.3 108.46,101.6 91.31,101.6 89.28,103.63 U12.14
24V: length 110.4
  Top Layer w2.54: NOREF#8.1 59.71,27.43 U15.1 ; 7.75,109.6 9.02,110.87 19.05,110.87 20.7,109.22 ; 33.27,89.66 22.73,89.66 20.53,91.86 D1.1 20.53,104.56 C7.1 ; 69.6,107.7 66.34,110.95 35.24,110.95 32.87,108.59 ; U14.1 61.23,53.98 NOREF#19.1
  Bottom Layer w2.54: NOREF#8.1 57.91,23.36 DIANJI2.1 ; NOREF#19.1 59.18,53.85 59.18,47.12 56.51,44.44 DIANJI4.1
24V_1: length 2.4
  Top Layer w2.54: U14.4 66.41,53.09 NOREF#17.1
24V_2: length 2.3
  Top Layer w2.54: U15.4 65.55,27.67 NOREF#10.2
GND: length 175.8
  Top Layer w0.381: FPC1.9 6.1,61.57
  Top Layer w0.508: C4.2 66.68,35.63 66.68,33.91 65.8,33.04 U15.5
  Top Layer w1.016: U14.5 67.11,59.58 C2.2 73.41,57.47 ; 73.41,57.47 C3.1 ; 73.41,57.47 73.03,57.09 73.03,49.4
  Top Layer w1.27: C4.2 72.58,35.69 C5.1 76.77,37.72 86.36,37.72 89.66,34.42 89.66,27.18 85.89,23.41 DIANJI1.2
  Top Layer w2.54: DIANJI5.2 13.25,72.81 5.33,64.9 ; 5.9,54.17 5.9,30.8 13.84,22.86 ; 5.9,54.17 FPC1.12 ; 5.9,54.17 10.8,49.28 14.35,49.28 ; D1.2 NOREF#3.1
  Bottom Layer w2.54: 57.4,95.89 57.4,77.89 DIANJI7.2 ; NOREF#3.1 27.06,99.82
PA2_TIM2_CH3: length 66.2
  Inner1 w0.508: PWM3.1 70.53,95.97 67.56,98.93 19.81,98.93 15.37,94.49 U13.12
PA7_ADC1_INP7: length 86.2
  Top Layer w0.381: FPC1.2 14.2,58.07
  Top Layer w0.508: 15.11,57.15 NOREF#26.1
  Top Layer w1.016: 14.2,58.07 15.11,57.15
  Inner2 w0.508: NOREF#26.1 42.16,50.42 45.47,47.12 70.74,47.12 76.2,52.58 76.2,60.2 NOREF#14.1
PB11_TIM2_CH4: length 104.8
  Inner1 w0.508: U13.10 13.59,97.03 18.8,102.24 74.17,102.24 82.68,93.73 82.68,77.13 PWM6.1
PB14_DIR_CONV: length 83.4
  Inner1 w0.508: U13.24 18.8,79.25 24.38,73.66 24.38,67.31 28.19,63.5 78.37,63.5 DIANJI3.4
PB15_DIR_CONV: length 19.7
  Inner1 w0.508: DIANJI5.4 29.08,81.79 U13.22
PC0_ADC1_INP10: length 88.6
  Top Layer w0.762: 8.64,55.12 9.51,54.25 24.15,54.25 NOREF#5.1 ; NOREF#13.1 73.47,33.02 C5.2 73.66,30.5 R2.2
  Inner2 w0.508: NOREF#13.1 70.87,37.59 68.71,39.75 26.8,39.75 24.64,41.91 NOREF#5.1
PC6_TIM3_CH1: length 72.7
  Top Layer w0.508: U13.11 9.52,93.22 13.21,93.22 19.65,86.78 NOREF#25.1
  Inner1 w0.508: PWM1.1 59.09,80.65 47.88,80.65 42.93,85.6 24.04,85.6 NOREF#25.1
PC7_TIM3_CH2: length 110.5
  Top Layer w0.508: NOREF.1 53.72,97.2 PWM2.1 ; NOREF#12.1 U13.9
  Inner2 w0.508: NOREF#12.1 0.81,97.87 0.81,110.03 2.49,111.71 51.35,111.71 53.72,109.35 NOREF.1
PD8_DIR_CONV: length 52.2
  Inner2 w0.508: NOREF#9.1 26.8,75.44 33.27,75.44 49.27,59.44 DIANJI4.4
  Bottom Layer w0.508: U13.20 17.91,84.33 NOREF#9.1
PD9_DIR_CONV: length 65.9
  Inner2 w0.508: DIANJI6.4 23.61,32.9 17.78,38.74 17.78,79.88 U13.18
PD10_DIR_CONV: length 40.5
  Inner2 w0.508: DIANJI8.4 21.72,67.57 21.72,82.42 14.73,89.41 U13.16
PD11_DIR_CONV: length 45.5
  Inner1 w0.508: DIANJI7.4 46.74,89.15 22.86,89.15 20.07,91.95 U13.14
PD12_TIM4_CH1_CONV: length 67.8
  Top Layer w0.508: DIANJI4.3 52.62,54.36 NOREF#18.1
  Inner1 w0.508: NOREF#24.1 NOREF#27.1
  Inner2 w0.508: NOREF#27.1 19.81,75.31 19.81,60.2 22.86,57.15 33.66,57.15 NOREF#18.1 ; U13.19 9.51,83.07 11.54,83.07 15.37,79.25 NOREF#24.1
PD13_TIM4_CH2_CONV: length 88.4
  Top Layer w0.508: U13.17 NOREF#6.1
  Inner2 w0.508: DIANJI6.3 30.14,27.81 12.83,27.81 0.55,40.09 0.55,85.39 NOREF#6.1
PD14_TIM4_CH3_CONV: length 102.2
  Inner1 w0.508: NOREF#15.1 46.1,70.23 NOREF#7.2
  Inner2 w0.508: NOREF#22.1 27.69,86.87 34.54,86.87 40.39,81.03 NOREF#15.1
  Bottom Layer w0.508: NOREF#22.1 21.72,83.82 17.4,88.14 9.52,88.14 U13.15 ; NOREF#7.2 58.42,65.66 56.64,63.88 38.23,63.88 30.1,55.75 DIANJI8.3
PD15_TIM4_CH4_CONV: length 50.1
  Bottom Layer w0.508: U13.13 9.52,90.68 17.65,90.68 19.43,88.9 42,88.9 DIANJI7.3
PE9_TIM1_CH1_CONV: length 225.3
  Inner1 w0.508: U13.27 8.25,66.42 14.86,59.82 14.86,6.99 20.07,1.78 57.22,1.78 76.33,20.88 76.33,24 80.73,28.41 DIANJI1.3 94.32,28.41 103.38,37.47 103.38,66.97 PWM7.1
PE10_DIR_CONV: length 147.3
  Inner1 w0.508: U13.28 10.8,68.83 18.67,60.96 18.67,8 21.46,5.21 56.13,5.21 72.9,21.97 72.9,25.4 80.91,33.41 DIANJI1.4
PE11_TIM1_CH2_CONV: length 196.3
  Top Layer w0.508: DIANJI2.3 55.88,31.33 55.88,35.56 60.96,40.64 86.74,40.64 95.12,49.02 95.12,56.13 83.57,67.69 83.57,85.94 PWM8.1
  Inner2 w0.508: U13.25 5.97,76.71 3.43,74.17 3.43,43.82 17.02,30.23 50.63,30.23 DIANJI2.3
PE12_DIR_CONV: length 121.3
  Inner1 w0.508: U13.26 15.62,71.88 15.62,67.82 21.97,61.47 21.97,11.18 24.64,8.51 42.04,8.51 45.59,12.06 45.59,27.56 51.19,33.15 DIANJI2.4
PE13_TIM1_CH3_CONV: length 260.2
  Inner1 w0.508: NOREF#2.1 NOREF#11.1
  Inner2 w0.508: U13.23 NOREF#2.1 ; NOREF#11.1 87.63,10.8 96.9,20.07 96.9,39.97 DIANJI3.3
  Bottom Layer w0.508: DIANJI3.3 100.29,54.57 109.22,63.5 109.22,80.05 PWM9.1
PE14_TIM1_CH4_CONV: length 148.3
  Top Layer w0.381: DIANJI5.3 27.39,80.52 9.52,80.52 U13.21
  Top Layer w0.508: PWM10.1 120.14,81.57 120.14,74.17 109.73,63.75 NOREF#21.1
  Inner1 w0.508: DIANJI5.3 46.4,77.81 48.39,75.82 58.04,75.82 60.76,73.1 60.76,69.92 64.26,66.42 91.57,66.42 NOREF#21.1
$1N7510: length 5.2
  Top Layer w0.508: R1.1 66.44,61.47 63.63,61.47 62.74,60.58 U14.7
$1N7913: length 6.8
  Top Layer w0.508: R2.1 65.68,29.84 62.87,29.84 61.21,31.5 U15.7

## Copper pours and planes (outline as drawn; the poured copper is in the pictures)
3V32 on Top Layer: 7.84,64.02 14.86,64.02 14.86,62.1 7.84,62.1
3V32 on Top Layer: 58.67,60.96 61.72,60.96 61.72,58.89 58.67,58.89
24V on Top Layer: 31.82,110.36 34.92,110.36 34.92,103 31.82,103
24V on Top Layer: 3.68,109.98 9.27,109.98 9.27,98.43 3.68,98.43
24V on Top Layer: 68.98,110.26 90.04,110.26 90.04,105.54 68.98,105.54
24V on Top Layer: 59.06,28.7 61.59,28.7 61.59,26.54 59.06,26.54
24V on Top Layer: 31.82,103.2 34.92,103.2 34.92,93.22 31.82,93.22
24V on Top Layer: 19.18,109.98 22.35,109.98 22.35,102.11 19.18,102.11
24V on Top Layer: 60.45,55.25 63.12,55.25 63.12,53.09 60.45,53.09
24V on Top Layer: 31.82,93.57 34.92,93.57 34.92,88.39 31.82,88.39
24V on Bottom Layer: 3.68,98.43 6.48,98.43 6.48,66.42 3.68,66.42
24V on Bottom Layer: 3.68,103.25 9.27,103.25 9.27,98.43 3.68,98.43
24V on Bottom Layer: 18.92,46.48 54.86,46.48 54.86,42.29 18.92,42.29
24V on Bottom Layer: 5.84,69.72 55.25,69.72 55.25,66.29 5.84,66.29
24V on Bottom Layer: 19.18,20.07 54.36,20.07 54.36,16.26 19.18,16.26
24V on Bottom Layer: 15.67,68.01 19.43,68.01 19.43,41.91 15.67,41.91
24V on Bottom Layer: 15.67,42.49 19.56,42.49 19.56,15.24 15.67,15.24
24V_1 on Top Layer: 63.37,55.4 65.91,55.4 65.91,52.96 63.37,52.96
24V_1 on Bottom Layer: 66.17,54.61 68.58,54.61 68.58,43.07 66.17,43.07
24V_1 on Bottom Layer: 68.2,46.18 84.11,46.18 84.11,43.07 68.2,43.07
24V_2 on Top Layer: 62.1,28.7 64.52,28.7 64.52,26.42 62.1,26.42
24V_2 on Bottom Layer: 66.29,19.81 83.19,19.81 83.19,16.64 66.29,16.64
24V_2 on Bottom Layer: 64.83,28.39 66.55,28.39 66.55,16.64 64.83,16.64
GND on Top Layer: 27.11,74.81 54.48,74.81 54.48,70.99 27.11,70.99
GND on Top Layer: 3.56,66.04 6.98,66.04 6.98,53.47 3.56,53.47
GND on Top Layer: 12.55,25.38 84.07,25.38 84.07,20.7 12.55,20.7
GND on Top Layer: 12.95,51.18 84.84,51.18 84.84,47.37 12.95,47.37
GND on Bottom Layer: 74.47,97.54 115.7,97.54 115.7,94.35 74.47,94.35
GND on Bottom Layer: 103.5,103.63 106.43,103.63 106.43,96.27 103.5,96.27
GND on Bottom Layer: 36.58,107.06 40.39,107.06 40.39,93.98 36.58,93.98
GND on Bottom Layer: 12.95,101.22 37.72,101.22 37.72,98.55 12.95,98.55
GND on Bottom Layer: 9.65,108.46 13.21,108.46 13.21,98.55 9.65,98.55
GND on Bottom Layer: 113.16,94.49 115.67,94.49 115.67,77.74 113.16,77.74
GND on Bottom Layer: 74.45,94.98 78.03,94.98 78.03,67.99 74.45,67.99
GND on Bottom Layer: 24.13,106.43 26.67,106.43 26.67,100.97 24.13,100.97
GND on Bottom Layer: 93.85,95 97.03,95 97.03,68.2 93.85,68.2
GND on Bottom Layer: 90.42,108.33 106.3,108.33 106.3,102.87 90.42,102.87
GND on Bottom Layer: 36.58,97.66 78.9,97.66 78.9,94.24 36.58,94.24
PA7_ADC1_INP7 on Top Layer: 10.67,58.55 14.2,58.55 14.2,58.07 10.67,58.07
PA7_ADC1_INP7 on Top Layer: 73.03,62.05 76.96,62.05 76.96,58.93 73.03,58.93
PC0_ADC1_INP10 on Top Layer: 8,57.53 9.14,57.53 9.14,54.48 8,54.48
